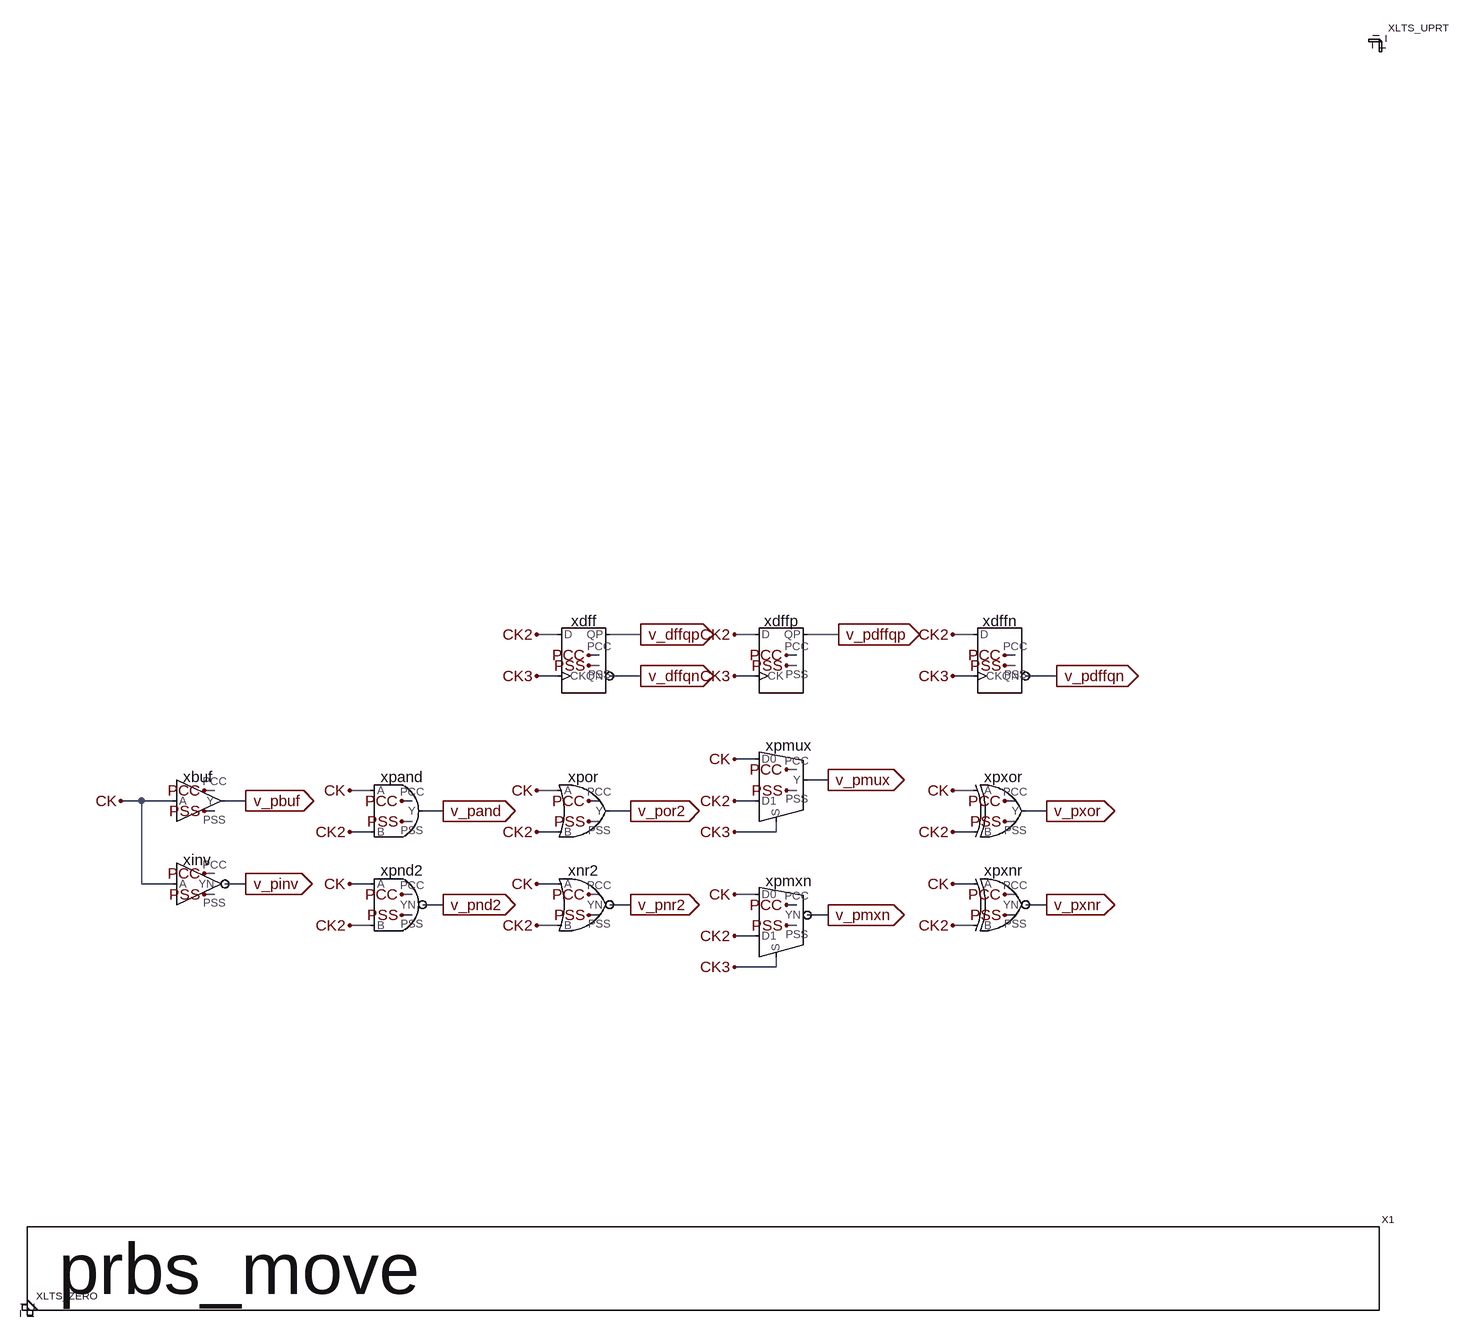
[diagram p0: schematic prbs_move.asc]
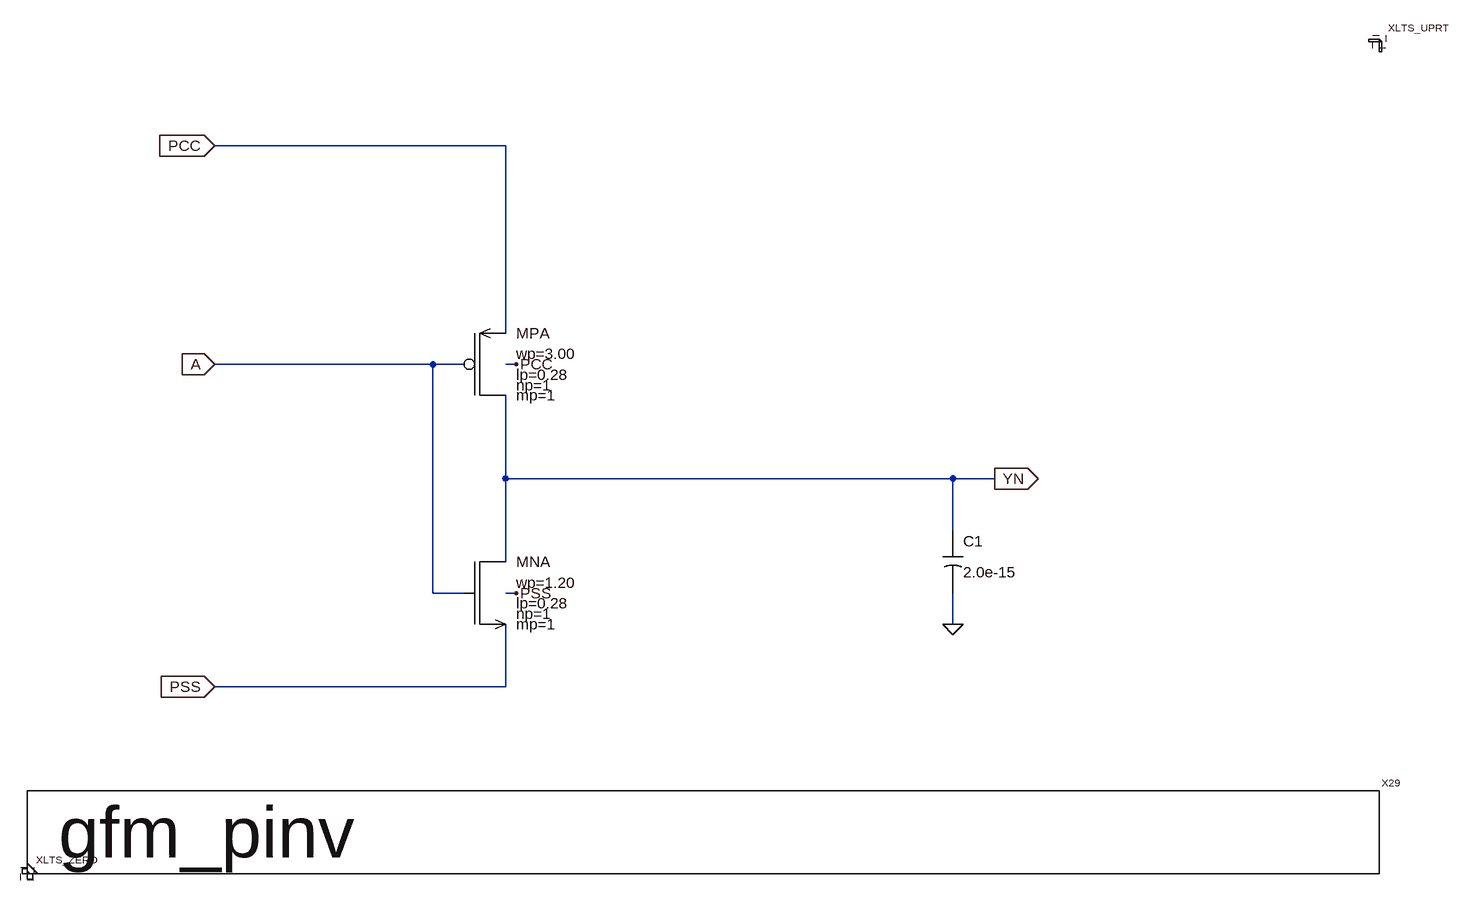
[diagram p1: sub-circuit gfm_pinv.asc]
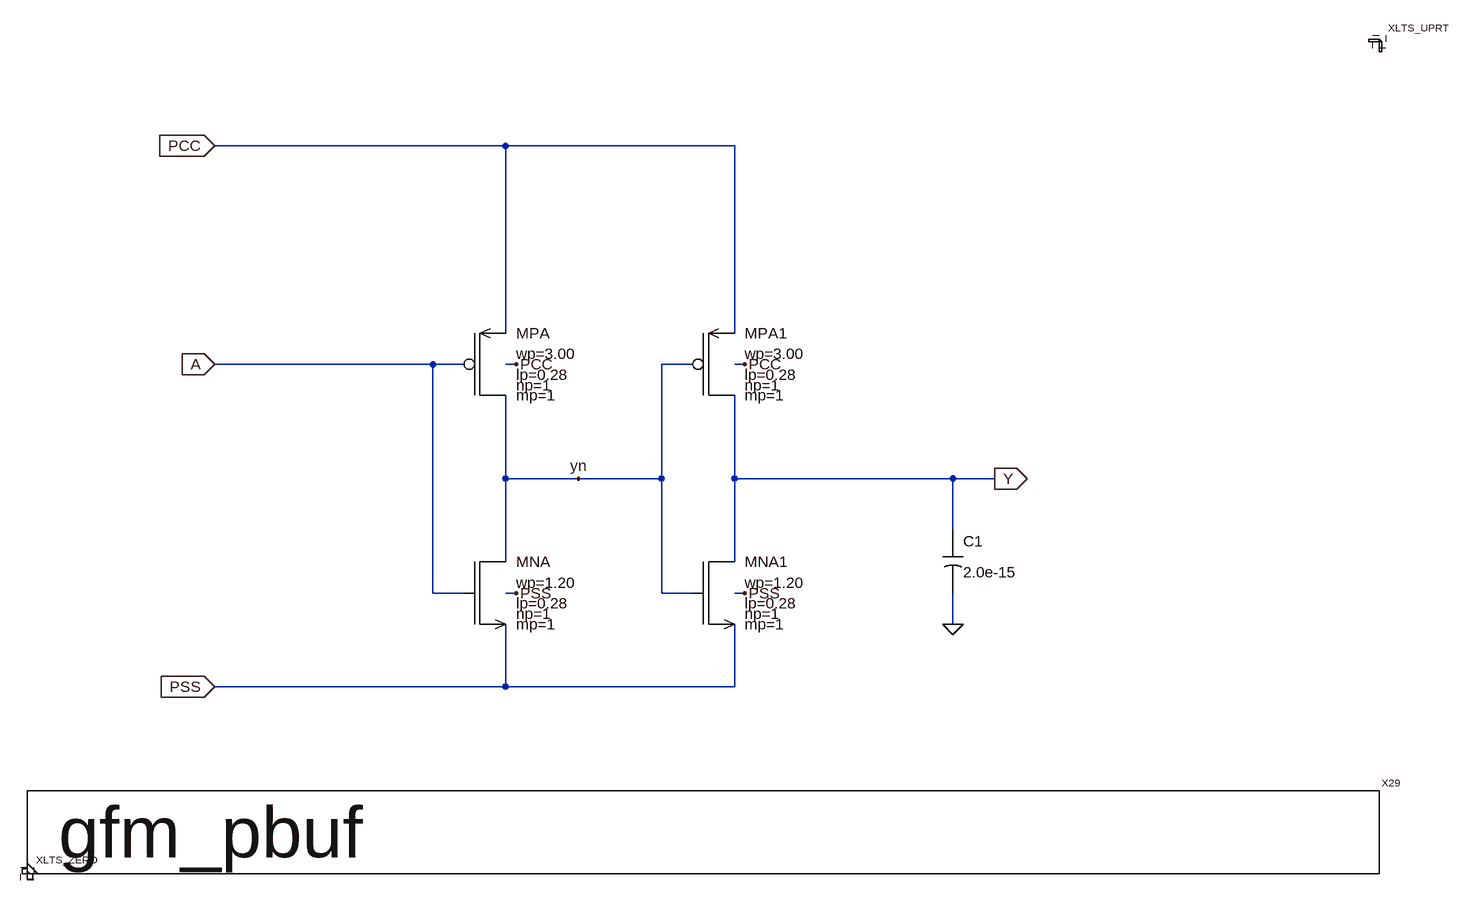
[diagram p2: sub-circuit gfm_pbuf.asc]
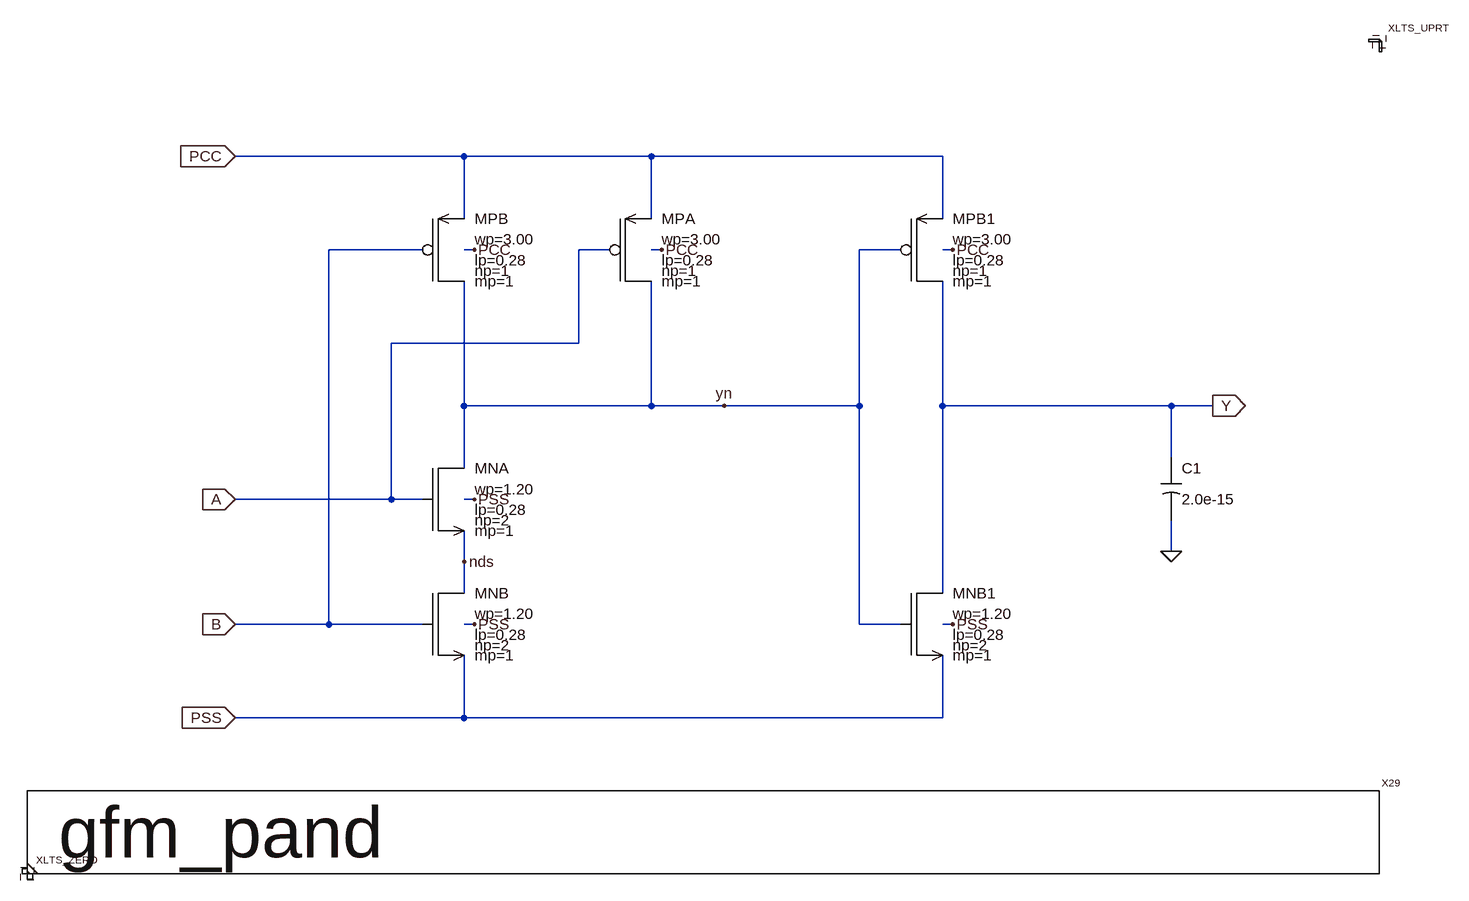
[diagram p3: sub-circuit gfm_pand.asc]
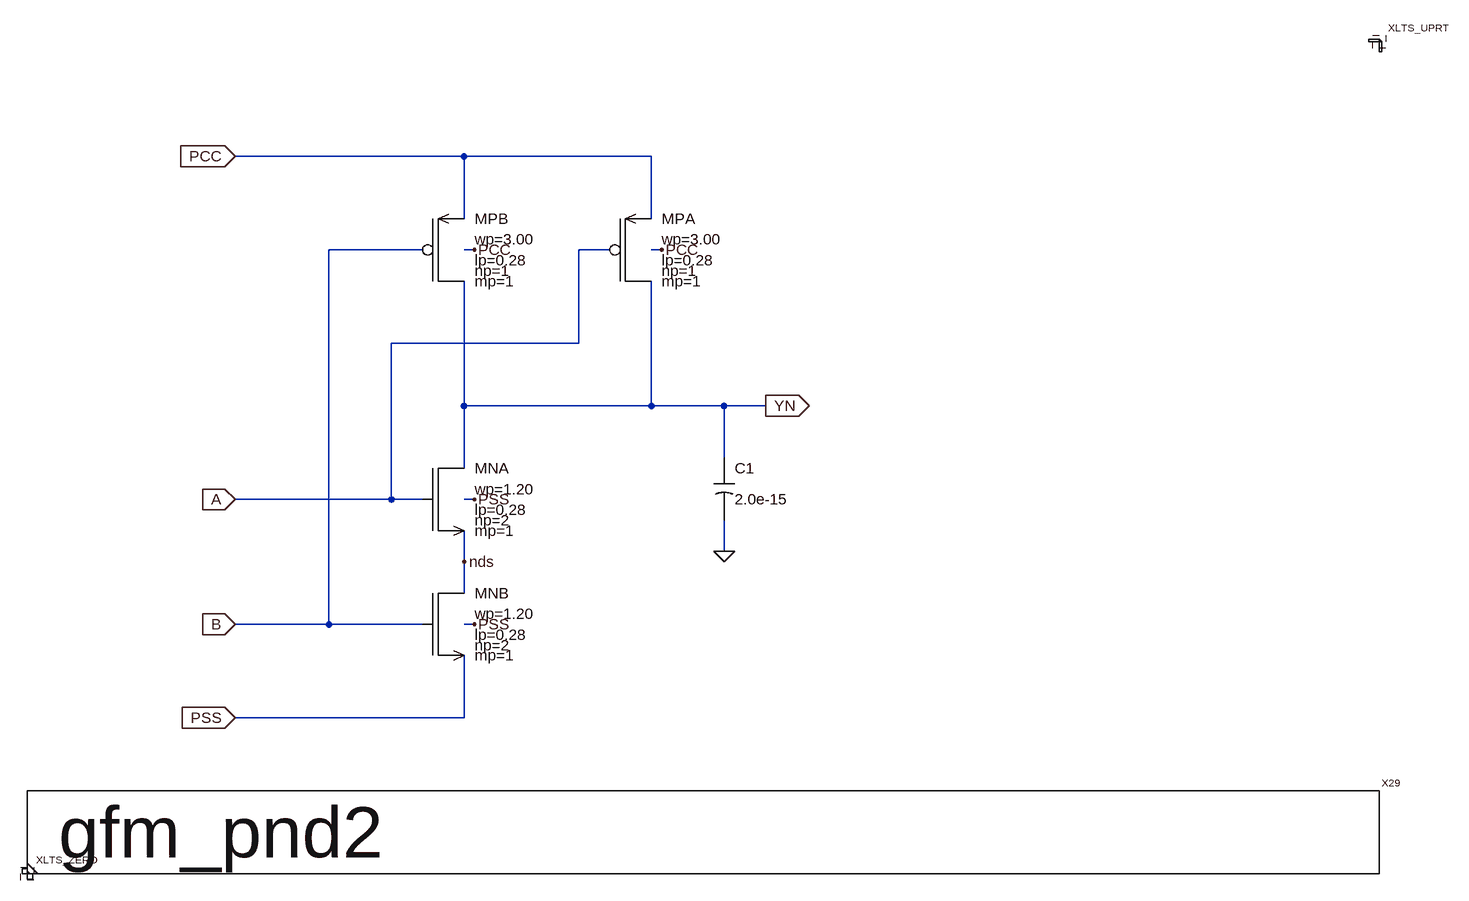
[diagram p4: sub-circuit gfm_pnd2.asc]
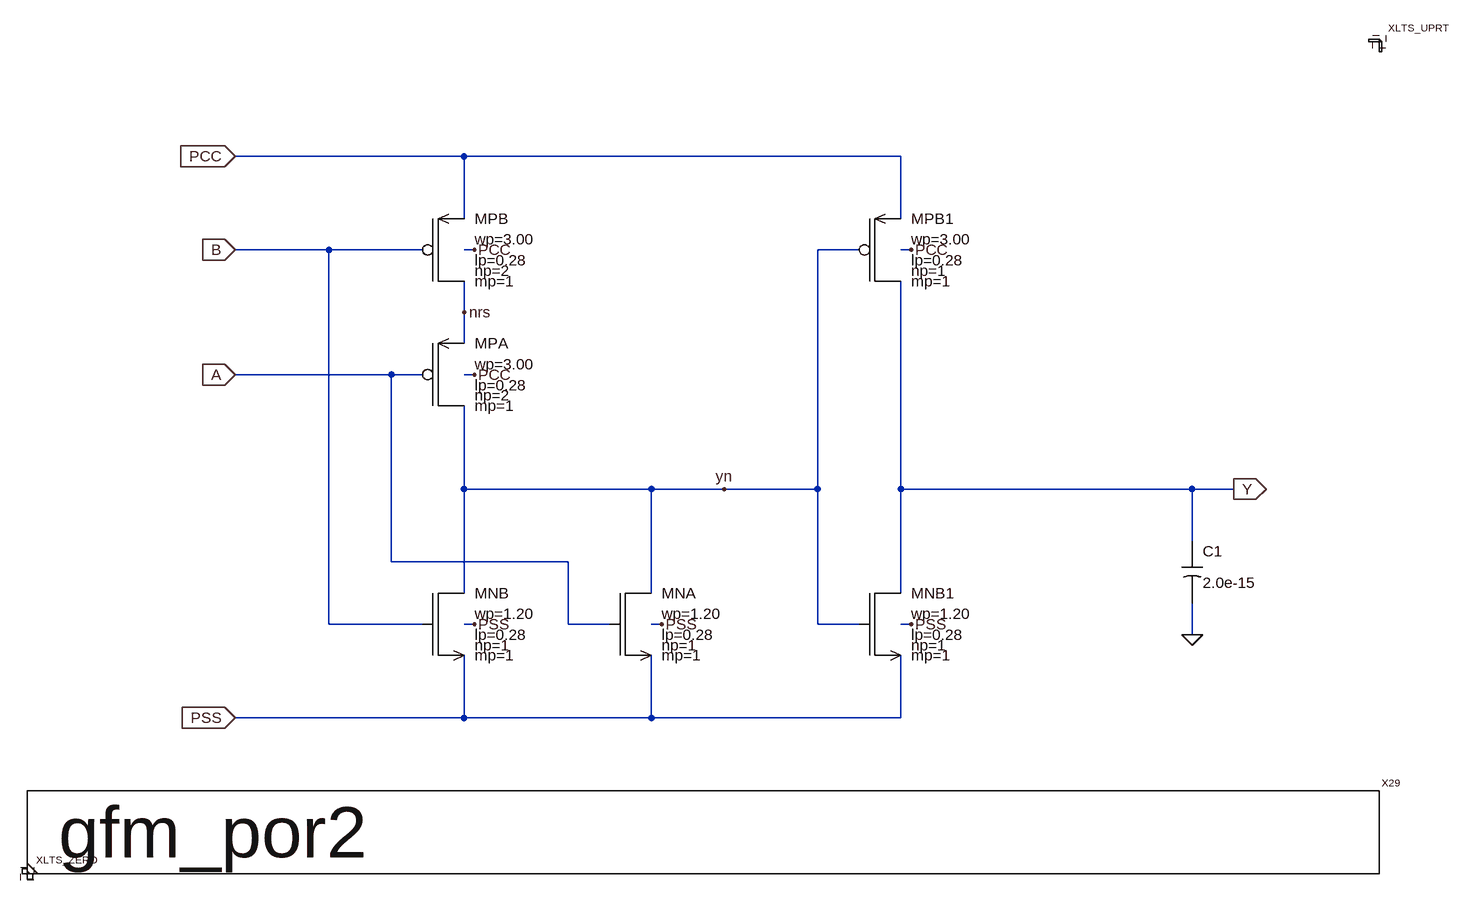
[diagram p5: sub-circuit gfm_por2.asc]
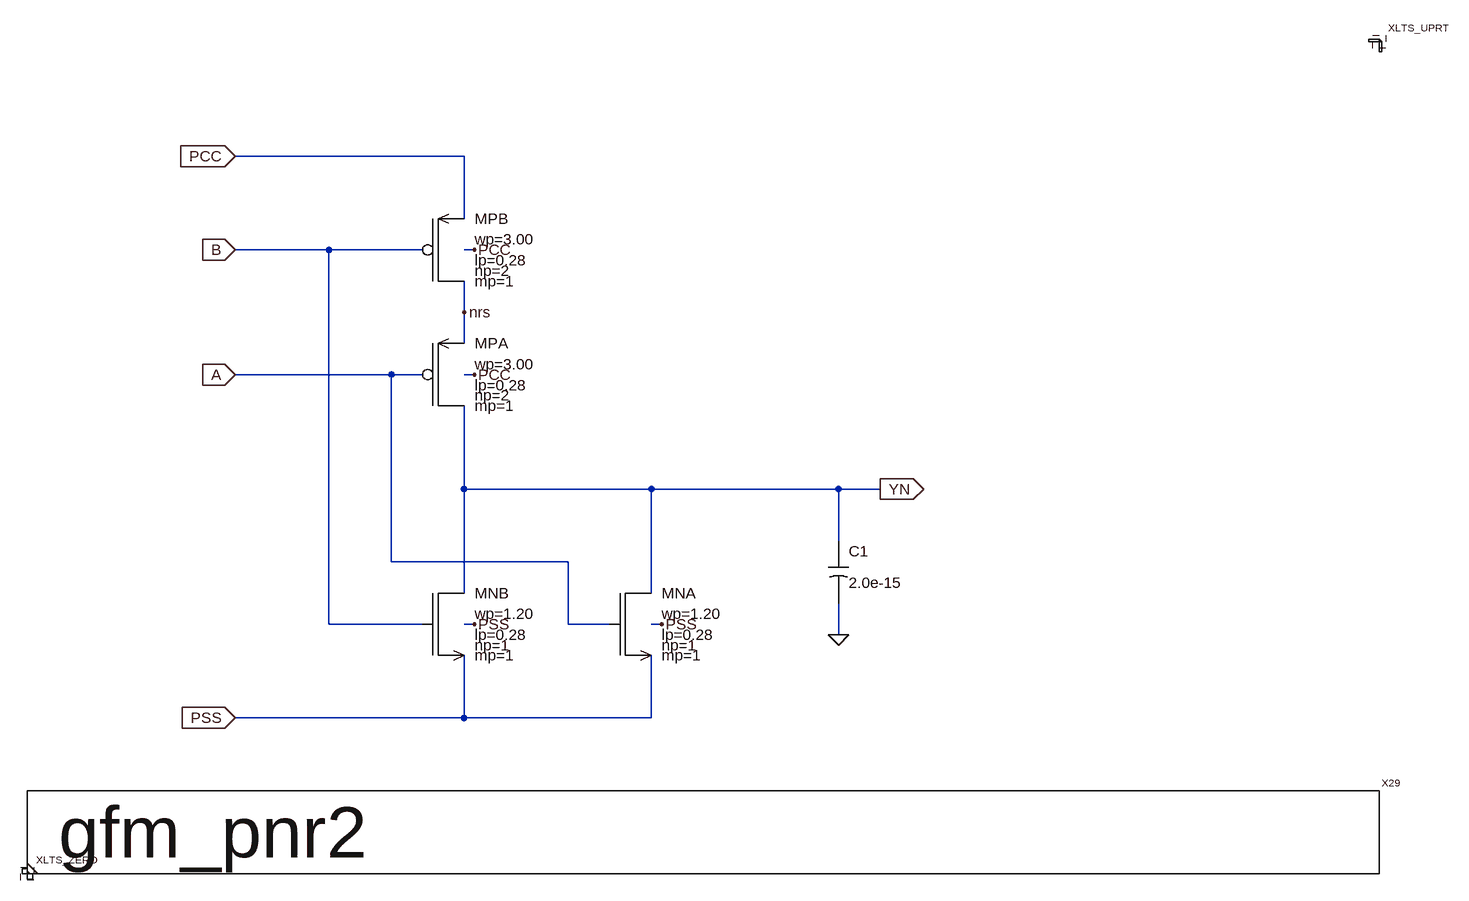
[diagram p6: sub-circuit gfm_pnr2.asc]
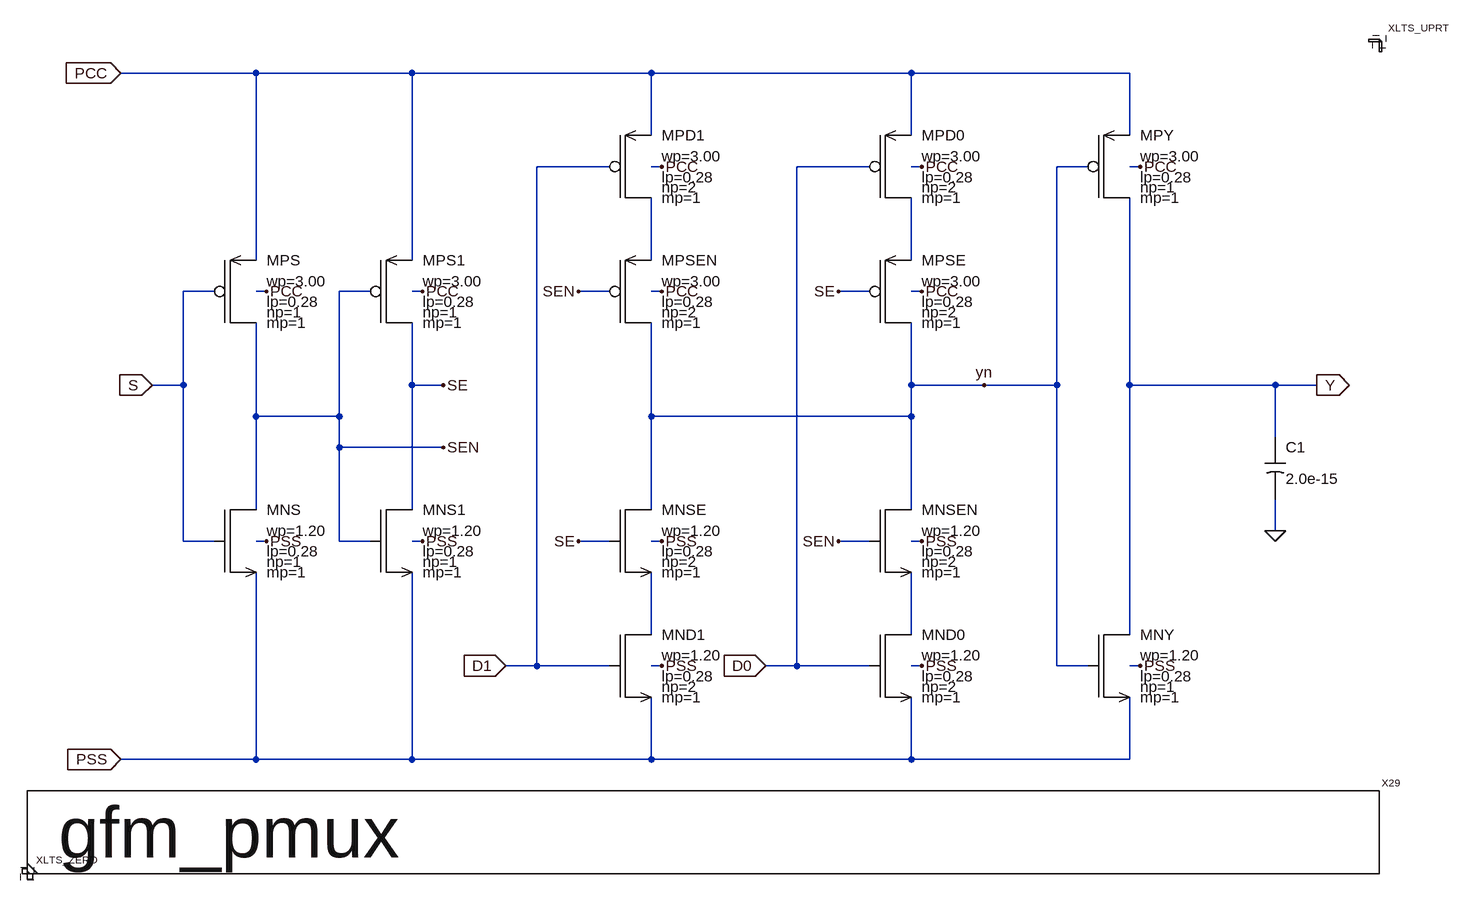
[diagram p7: sub-circuit gfm_pmux.asc]
prbs_move.asc, the LTspice schematic file:
Version 4.1
SHEET 1 4824 680
WIRE 816 -1040 784 -1040
WIRE 944 -1040 896 -1040
WIRE 1120 -1040 1088 -1040
WIRE 1248 -1040 1200 -1040
WIRE 1456 -1040 1424 -1040
WIRE 880 -1008 864 -1008
WIRE 1184 -1008 1168 -1008
WIRE 1520 -1008 1504 -1008
WIRE 880 -992 864 -992
WIRE 1184 -992 1168 -992
WIRE 1520 -992 1504 -992
WIRE 816 -976 784 -976
WIRE 944 -976 896 -976
WIRE 1120 -976 1088 -976
WIRE 1456 -976 1424 -976
WIRE 1584 -976 1536 -976
WIRE 1120 -848 1088 -848
WIRE 1184 -832 1168 -832
WIRE 1232 -816 1200 -816
WIRE 288 -800 272 -800
WIRE 528 -800 496 -800
WIRE 816 -800 784 -800
WIRE 1184 -800 1168 -800
WIRE 1456 -800 1424 -800
WIRE 176 -784 144 -784
WIRE 224 -784 176 -784
WIRE 336 -784 304 -784
WIRE 592 -784 576 -784
WIRE 880 -784 864 -784
WIRE 1120 -784 1088 -784
WIRE 1520 -784 1504 -784
WIRE 288 -768 272 -768
WIRE 640 -768 608 -768
WIRE 928 -768 896 -768
WIRE 1568 -768 1536 -768
WIRE 592 -752 576 -752
WIRE 880 -752 864 -752
WIRE 1520 -752 1504 -752
WIRE 528 -736 496 -736
WIRE 816 -736 784 -736
WIRE 1152 -736 1152 -752
WIRE 1152 -736 1088 -736
WIRE 1456 -736 1424 -736
WIRE 288 -672 272 -672
WIRE 176 -656 176 -784
WIRE 224 -656 176 -656
WIRE 336 -656 304 -656
WIRE 528 -656 496 -656
WIRE 816 -656 784 -656
WIRE 1456 -656 1424 -656
WIRE 288 -640 272 -640
WIRE 592 -640 576 -640
WIRE 880 -640 864 -640
WIRE 1120 -640 1088 -640
WIRE 1520 -640 1504 -640
WIRE 640 -624 608 -624
WIRE 928 -624 896 -624
WIRE 1184 -624 1168 -624
WIRE 1568 -624 1536 -624
WIRE 592 -608 576 -608
WIRE 880 -608 864 -608
WIRE 1232 -608 1200 -608
WIRE 1520 -608 1504 -608
WIRE 528 -592 496 -592
WIRE 816 -592 784 -592
WIRE 1184 -592 1168 -592
WIRE 1456 -592 1424 -592
WIRE 1120 -576 1088 -576
WIRE 1152 -528 1152 -544
WIRE 1152 -528 1088 -528
FLAG 272 -672 PCC
FLAG 272 -768 PSS
FLAG 272 -640 PSS
FLAG 272 -800 PCC
FLAG 144 -784 CK
FLAG 576 -784 PCC
FLAG 576 -752 PSS
FLAG 496 -800 CK
FLAG 496 -736 CK2
FLAG 640 -768 v_pand
IOPIN 640 -768 Out
FLAG 576 -640 PCC
FLAG 576 -608 PSS
FLAG 496 -656 CK
FLAG 496 -592 CK2
FLAG 640 -624 v_pnd2
IOPIN 640 -624 Out
FLAG 864 -784 PCC
FLAG 864 -752 PSS
FLAG 784 -800 CK
FLAG 784 -736 CK2
FLAG 928 -768 v_por2
IOPIN 928 -768 Out
FLAG 864 -640 PCC
FLAG 864 -608 PSS
FLAG 784 -656 CK
FLAG 784 -592 CK2
FLAG 928 -624 v_pnr2
IOPIN 928 -624 Out
FLAG 1088 -848 CK
FLAG 1088 -784 CK2
FLAG 1088 -736 CK3
FLAG 1088 -528 CK3
FLAG 1088 -640 CK
FLAG 1088 -576 CK2
FLAG 1168 -624 PCC
FLAG 1168 -592 PSS
FLAG 1168 -832 PCC
FLAG 1168 -800 PSS
FLAG 1232 -816 v_pmux
IOPIN 1232 -816 Out
FLAG 1232 -608 v_pmxn
IOPIN 1232 -608 Out
FLAG 1504 -784 PCC
FLAG 1504 -752 PSS
FLAG 1424 -800 CK
FLAG 1424 -736 CK2
FLAG 1568 -768 v_pxor
IOPIN 1568 -768 Out
FLAG 1504 -640 PCC
FLAG 1504 -608 PSS
FLAG 1424 -656 CK
FLAG 1424 -592 CK2
FLAG 1568 -624 v_pxnr
IOPIN 1568 -624 Out
FLAG 864 -1008 PCC
FLAG 864 -992 PSS
FLAG 784 -976 CK3
FLAG 784 -1040 CK2
FLAG 944 -1040 v_dffqp
IOPIN 944 -1040 Out
FLAG 944 -976 v_dffqn
IOPIN 944 -976 Out
FLAG 1168 -1008 PCC
FLAG 1168 -992 PSS
FLAG 1088 -976 CK3
FLAG 1088 -1040 CK2
FLAG 1248 -1040 v_pdffqp
IOPIN 1248 -1040 Out
FLAG 1504 -1008 PCC
FLAG 1504 -992 PSS
FLAG 1424 -976 CK3
FLAG 1424 -1040 CK2
FLAG 1584 -976 v_pdffqn
IOPIN 1584 -976 Out
FLAG 336 -784 v_pbuf
IOPIN 336 -784 Out
FLAG 336 -656 v_pinv
IOPIN 336 -656 Out
SYMBOL BD_GTitleLTS 0 0 R0
SYMATTR SpiceModel prbs_move
SYMATTR InstName X1
SYMBOL gfm_pinv 224 -656 R0
SYMATTR InstName xinv
SYMBOL gfm_pbuf 224 -784 R0
SYMATTR InstName xbuf
SYMBOL gfm_pand 528 -768 R0
SYMATTR InstName xpand
SYMBOL gfm_pnd2 528 -624 R0
SYMATTR InstName xpnd2
SYMBOL gfm_por2 816 -768 R0
SYMATTR InstName xpor
SYMBOL gfm_pnr2 816 -624 R0
SYMATTR InstName xnr2
SYMBOL gfm_pmux 1120 -816 R0
SYMATTR InstName xpmux
SYMBOL gfm_pmxn 1120 -608 R0
SYMATTR InstName xpmxn
SYMBOL gfm_pxor 1456 -768 R0
SYMATTR InstName xpxor
SYMBOL gfm_pxnr 1456 -624 R0
SYMATTR InstName xpxnr
SYMBOL gfm_dff 816 -1008 R0
SYMATTR InstName xdff
SYMBOL gfm_dffp 1120 -1008 R0
SYMATTR InstName xdffp
SYMBOL gfm_dffn 1456 -1008 R0
SYMATTR InstName xdffn
SYMBOL BD_ZERO 0 0 R0
SYMATTR InstName XLTS_ZERO
SYMBOL BD_UPRT 2080 -1952 R0
SYMATTR InstName XLTS_UPRT

The netlist it stands for:
* prbs_move.asc
X§X1 BD_GTitleLTS
X§xinv v_pinv CK PCC PSS gfm_pinv
X§xbuf v_pbuf CK PCC PSS gfm_pbuf
X§xpand v_pand CK CK2 PCC PSS gfm_pand
X§xpnd2 v_pnd2 CK CK2 PCC PSS gfm_pnd2
X§xpor v_por2 CK CK2 PCC PSS gfm_por2
X§xnr2 v_pnr2 CK CK2 PCC PSS gfm_pnr2
X§xpmux v_pmux CK CK2 CK3 PCC PSS gfm_pmux
X§xpmxn v_pmxn CK CK2 CK3 PCC PSS gfm_pmxn
X§xpxor v_pxor CK CK2 PCC PSS gfm_pxor
X§xpxnr v_pxnr CK CK2 PCC PSS gfm_pxnr
X§xdff v_dffqp v_dffqn CK2 CK3 PCC PSS gfm_dff
X§xdffp v_pdffqp CK2 CK3 PCC PSS gfm_dffp
X§xdffn v_pdffqn CK2 CK3 PCC PSS gfm_dffn
X§XLTS_ZERO BD_ZERO
X§XLTS_UPRT BD_UPRT

* block symbol definitions
.subckt gfm_pinv YN A PCC PSS
XX29 BD_GTitleLTS
C1 YN 0 2.0e-15
XMPA YN A PCC PCC gfmcu_pmos3p3 wp=3.00 lp=0.28 np=1 mp=1  ; pins ND NG NS NB
XMNA YN A PSS PSS gfmcu_nmos3p3 wp=1.20 lp=0.28 np=1 mp=1  ; pins ND NG NS NB
XXLTS_ZERO BD_ZERO
XXLTS_UPRT BD_UPRT
.ends gfm_pinv

.subckt gfm_pbuf Y A PCC PSS
XX29 BD_GTitleLTS
C1 Y 0 2.0e-15
XMPA yn A PCC PCC gfmcu_pmos3p3 wp=3.00 lp=0.28 np=1 mp=1  ; pins ND NG NS NB
XMNA yn A PSS PSS gfmcu_nmos3p3 wp=1.20 lp=0.28 np=1 mp=1  ; pins ND NG NS NB
XMPA1 Y yn PCC PCC gfmcu_pmos3p3 wp=3.00 lp=0.28 np=1 mp=1  ; pins ND NG NS NB
XMNA1 Y yn PSS PSS gfmcu_nmos3p3 wp=1.20 lp=0.28 np=1 mp=1  ; pins ND NG NS NB
XXLTS_ZERO BD_ZERO
XXLTS_UPRT BD_UPRT
.ends gfm_pbuf

.subckt gfm_pand Y A B PCC PSS
XX29 BD_GTitleLTS
XMPA yn A PCC PCC gfmcu_pmos3p3 wp=3.00 lp=0.28 np=1 mp=1  ; pins ND NG NS NB
XMPB yn B PCC PCC gfmcu_pmos3p3 wp=3.00 lp=0.28 np=1 mp=1  ; pins ND NG NS NB
XMNA yn A nds PSS gfmcu_nmos3p3 wp=1.20 lp=0.28 np=2 mp=1  ; pins ND NG NS NB
XMNB nds B PSS PSS gfmcu_nmos3p3 wp=1.20 lp=0.28 np=2 mp=1  ; pins ND NG NS NB
C1 Y 0 2.0e-15
XMPB1 Y yn PCC PCC gfmcu_pmos3p3 wp=3.00 lp=0.28 np=1 mp=1  ; pins ND NG NS NB
XMNB1 Y yn PSS PSS gfmcu_nmos3p3 wp=1.20 lp=0.28 np=2 mp=1  ; pins ND NG NS NB
XXLTS_ZERO BD_ZERO
XXLTS_UPRT BD_UPRT
.ends gfm_pand

.subckt gfm_pnd2 YN A B PCC PSS
XX29 BD_GTitleLTS
XMPA YN A PCC PCC gfmcu_pmos3p3 wp=3.00 lp=0.28 np=1 mp=1  ; pins ND NG NS NB
XMPB YN B PCC PCC gfmcu_pmos3p3 wp=3.00 lp=0.28 np=1 mp=1  ; pins ND NG NS NB
XMNA YN A nds PSS gfmcu_nmos3p3 wp=1.20 lp=0.28 np=2 mp=1  ; pins ND NG NS NB
XMNB nds B PSS PSS gfmcu_nmos3p3 wp=1.20 lp=0.28 np=2 mp=1  ; pins ND NG NS NB
C1 YN 0 2.0e-15
XXLTS_ZERO BD_ZERO
XXLTS_UPRT BD_UPRT
.ends gfm_pnd2

.subckt gfm_por2 Y A B PCC PSS
XX29 BD_GTitleLTS
XMPA yn A nrs PCC gfmcu_pmos3p3 wp=3.00 lp=0.28 np=2 mp=1  ; pins ND NG NS NB
XMPB nrs B PCC PCC gfmcu_pmos3p3 wp=3.00 lp=0.28 np=2 mp=1  ; pins ND NG NS NB
XMNA yn A PSS PSS gfmcu_nmos3p3 wp=1.20 lp=0.28 np=1 mp=1  ; pins ND NG NS NB
XMNB yn B PSS PSS gfmcu_nmos3p3 wp=1.20 lp=0.28 np=1 mp=1  ; pins ND NG NS NB
C1 Y 0 2.0e-15
XMPB1 Y yn PCC PCC gfmcu_pmos3p3 wp=3.00 lp=0.28 np=1 mp=1  ; pins ND NG NS NB
XMNB1 Y yn PSS PSS gfmcu_nmos3p3 wp=1.20 lp=0.28 np=1 mp=1  ; pins ND NG NS NB
XXLTS_ZERO BD_ZERO
XXLTS_UPRT BD_UPRT
.ends gfm_por2

.subckt gfm_pnr2 YN A B PCC PSS
XX29 BD_GTitleLTS
XMPA YN A nrs PCC gfmcu_pmos3p3 wp=3.00 lp=0.28 np=2 mp=1  ; pins ND NG NS NB
XMPB nrs B PCC PCC gfmcu_pmos3p3 wp=3.00 lp=0.28 np=2 mp=1  ; pins ND NG NS NB
XMNA YN A PSS PSS gfmcu_nmos3p3 wp=1.20 lp=0.28 np=1 mp=1  ; pins ND NG NS NB
XMNB YN B PSS PSS gfmcu_nmos3p3 wp=1.20 lp=0.28 np=1 mp=1  ; pins ND NG NS NB
C1 YN 0 2.0e-15
XXLTS_ZERO BD_ZERO
XXLTS_UPRT BD_UPRT
.ends gfm_pnr2

.subckt gfm_pmux Y D0 D1 S PCC PSS
XMNSE yn SE N003 PSS gfmcu_nmos3p3 wp=1.20 lp=0.28 np=2 mp=1  ; pins ND NG NS NB
XMND1 N003 D1 PSS PSS gfmcu_nmos3p3 wp=1.20 lp=0.28 np=2 mp=1  ; pins ND NG NS NB
C1 Y 0 2.0e-15
XMPSE yn SE N002 PCC gfmcu_pmos3p3 wp=3.00 lp=0.28 np=2 mp=1  ; pins ND NG NS NB
XMPD0 N002 D0 PCC PCC gfmcu_pmos3p3 wp=3.00 lp=0.28 np=2 mp=1  ; pins ND NG NS NB
XMPSEN yn SEN N001 PCC gfmcu_pmos3p3 wp=3.00 lp=0.28 np=2 mp=1  ; pins ND NG NS NB
XMPD1 N001 D1 PCC PCC gfmcu_pmos3p3 wp=3.00 lp=0.28 np=2 mp=1  ; pins ND NG NS NB
XX29 BD_GTitleLTS
XMNSEN yn SEN N004 PSS gfmcu_nmos3p3 wp=1.20 lp=0.28 np=2 mp=1  ; pins ND NG NS NB
XMND0 N004 D0 PSS PSS gfmcu_nmos3p3 wp=1.20 lp=0.28 np=2 mp=1  ; pins ND NG NS NB
XMNS SEN S PSS PSS gfmcu_nmos3p3 wp=1.20 lp=0.28 np=1 mp=1  ; pins ND NG NS NB
XMPS SEN S PCC PCC gfmcu_pmos3p3 wp=3.00 lp=0.28 np=1 mp=1  ; pins ND NG NS NB
XMNS1 SE SEN PSS PSS gfmcu_nmos3p3 wp=1.20 lp=0.28 np=1 mp=1  ; pins ND NG NS NB
XMPS1 SE SEN PCC PCC gfmcu_pmos3p3 wp=3.00 lp=0.28 np=1 mp=1  ; pins ND NG NS NB
XMPY Y yn PCC PCC gfmcu_pmos3p3 wp=3.00 lp=0.28 np=1 mp=1  ; pins ND NG NS NB
XMNY Y yn PSS PSS gfmcu_nmos3p3 wp=1.20 lp=0.28 np=1 mp=1  ; pins ND NG NS NB
XXLTS_ZERO BD_ZERO
XXLTS_UPRT BD_UPRT
.ends gfm_pmux

.subckt gfm_pmxn YN D0 D1 S PCC PSS
XMNSE YN SE N003 PSS gfmcu_nmos3p3 wp=1.20 lp=0.28 np=2 mp=1  ; pins ND NG NS NB
XMND1 N003 D1 PSS PSS gfmcu_nmos3p3 wp=1.20 lp=0.28 np=2 mp=1  ; pins ND NG NS NB
C1 YN 0 2.0e-15
XMPSE YN SE N002 PCC gfmcu_pmos3p3 wp=3.00 lp=0.28 np=2 mp=1  ; pins ND NG NS NB
XMPD0 N002 D0 PCC PCC gfmcu_pmos3p3 wp=3.00 lp=0.28 np=2 mp=1  ; pins ND NG NS NB
XMPSEN YN SEN N001 PCC gfmcu_pmos3p3 wp=3.00 lp=0.28 np=2 mp=1  ; pins ND NG NS NB
XMPD1 N001 D1 PCC PCC gfmcu_pmos3p3 wp=3.00 lp=0.28 np=2 mp=1  ; pins ND NG NS NB
XX29 BD_GTitleLTS
XMNSEN YN SEN N004 PSS gfmcu_nmos3p3 wp=1.20 lp=0.28 np=2 mp=1  ; pins ND NG NS NB
XMND0 N004 D0 PSS PSS gfmcu_nmos3p3 wp=1.20 lp=0.28 np=2 mp=1  ; pins ND NG NS NB
XMNS SEN S PSS PSS gfmcu_nmos3p3 wp=1.20 lp=0.28 np=1 mp=1  ; pins ND NG NS NB
XMPS SEN S PCC PCC gfmcu_pmos3p3 wp=3.00 lp=0.28 np=1 mp=1  ; pins ND NG NS NB
XMNS1 SE SEN PSS PSS gfmcu_nmos3p3 wp=1.20 lp=0.28 np=1 mp=1  ; pins ND NG NS NB
XMPS1 SE SEN PCC PCC gfmcu_pmos3p3 wp=3.00 lp=0.28 np=1 mp=1  ; pins ND NG NS NB
XXLTS_ZERO BD_ZERO
XXLTS_UPRT BD_UPRT
.ends gfm_pmxn

.subckt gfm_pxor Y A B PCC PSS
XMNA1 Y an N003 PSS gfmcu_nmos3p3 wp=1.20 lp=0.28 np=2 mp=1  ; pins ND NG NS NB
XMNB1 N003 bn PSS PSS gfmcu_nmos3p3 wp=1.20 lp=0.28 np=2 mp=1  ; pins ND NG NS NB
C1 Y 0 2.0e-15
XMPA2 Y A N002 PCC gfmcu_pmos3p3 wp=3.00 lp=0.28 np=2 mp=1  ; pins ND NG NS NB
XMPB2 N002 bn PCC PCC gfmcu_pmos3p3 wp=3.00 lp=0.28 np=2 mp=1  ; pins ND NG NS NB
XMPA1 Y an N001 PCC gfmcu_pmos3p3 wp=3.00 lp=0.28 np=2 mp=1  ; pins ND NG NS NB
XMPB1 N001 B PCC PCC gfmcu_pmos3p3 wp=3.00 lp=0.28 np=2 mp=1  ; pins ND NG NS NB
XX29 BD_GTitleLTS
XMNA2 Y A N004 PSS gfmcu_nmos3p3 wp=1.20 lp=0.28 np=2 mp=1  ; pins ND NG NS NB
XMNB2 N004 B PSS PSS gfmcu_nmos3p3 wp=1.20 lp=0.28 np=2 mp=1  ; pins ND NG NS NB
XMNA an A PSS PSS gfmcu_nmos3p3 wp=1.20 lp=0.28 np=1 mp=1  ; pins ND NG NS NB
XMPA an A PCC PCC gfmcu_pmos3p3 wp=3.00 lp=0.28 np=1 mp=1  ; pins ND NG NS NB
XMNB bn B PSS PSS gfmcu_nmos3p3 wp=1.20 lp=0.28 np=1 mp=1  ; pins ND NG NS NB
XMPB bn B PCC PCC gfmcu_pmos3p3 wp=3.00 lp=0.28 np=1 mp=1  ; pins ND NG NS NB
XXLTS_ZERO BD_ZERO
XXLTS_UPRT BD_UPRT
.ends gfm_pxor

.subckt gfm_pxnr YN A B PCC PSS
XMNA1 YN A N003 PSS gfmcu_nmos3p3 wp=1.20 lp=0.28 np=2 mp=1  ; pins ND NG NS NB
XMNB1 N003 bn PSS PSS gfmcu_nmos3p3 wp=1.20 lp=0.28 np=2 mp=1  ; pins ND NG NS NB
C1 YN 0 2.0e-15
XMPA2 YN an N002 PCC gfmcu_pmos3p3 wp=3.00 lp=0.28 np=2 mp=1  ; pins ND NG NS NB
XMPB2 N002 bn PCC PCC gfmcu_pmos3p3 wp=3.00 lp=0.28 np=2 mp=1  ; pins ND NG NS NB
XMPA1 YN A N001 PCC gfmcu_pmos3p3 wp=3.00 lp=0.28 np=2 mp=1  ; pins ND NG NS NB
XMPB1 N001 B PCC PCC gfmcu_pmos3p3 wp=3.00 lp=0.28 np=2 mp=1  ; pins ND NG NS NB
XX29 BD_GTitleLTS
XMNA2 YN an N004 PSS gfmcu_nmos3p3 wp=1.20 lp=0.28 np=2 mp=1  ; pins ND NG NS NB
XMNB2 N004 B PSS PSS gfmcu_nmos3p3 wp=1.20 lp=0.28 np=2 mp=1  ; pins ND NG NS NB
XMNA an A PSS PSS gfmcu_nmos3p3 wp=1.20 lp=0.28 np=1 mp=1  ; pins ND NG NS NB
XMPA an A PCC PCC gfmcu_pmos3p3 wp=3.00 lp=0.28 np=1 mp=1  ; pins ND NG NS NB
XMNB bn B PSS PSS gfmcu_nmos3p3 wp=1.20 lp=0.28 np=1 mp=1  ; pins ND NG NS NB
XMPB bn B PCC PCC gfmcu_pmos3p3 wp=3.00 lp=0.28 np=1 mp=1  ; pins ND NG NS NB
XXLTS_ZERO BD_ZERO
XXLTS_UPRT BD_UPRT
.ends gfm_pxnr

.subckt gfm_dff QP QN D CK PCC PSS
XMNSE ka cin N005 PSS gfmcu_nmos3p3 wp=1.20 lp=0.28 np=2 mp=1  ; pins ND NG NS NB
XMND1 N005 D PSS PSS gfmcu_nmos3p3 wp=1.20 lp=0.28 np=2 mp=1  ; pins ND NG NS NB
XMPSE ka cin N002 PCC gfmcu_pmos3p3 wp=3.00 lp=0.28 np=2 mp=1  ; pins ND NG NS NB
XMPD0 N002 kan PCC PCC gfmcu_pmos3p3 wp=3.00 lp=0.28 np=2 mp=1  ; pins ND NG NS NB
XMPSEN ka cip N001 PCC gfmcu_pmos3p3 wp=3.00 lp=0.28 np=2 mp=1  ; pins ND NG NS NB
XMPD1 N001 D PCC PCC gfmcu_pmos3p3 wp=3.00 lp=0.28 np=2 mp=1  ; pins ND NG NS NB
XX29 BD_GTitleLTS
XMNSEN ka cip N006 PSS gfmcu_nmos3p3 wp=1.20 lp=0.28 np=2 mp=1  ; pins ND NG NS NB
XMND0 N006 kan PSS PSS gfmcu_nmos3p3 wp=1.20 lp=0.28 np=2 mp=1  ; pins ND NG NS NB
XMNCK cin CK PSS PSS gfmcu_nmos3p3 wp=1.20 lp=0.28 np=1 mp=1  ; pins ND NG NS NB
XMPCK cin CK PCC PCC gfmcu_pmos3p3 wp=3.00 lp=0.28 np=1 mp=1  ; pins ND NG NS NB
XMNCKN cip cin PSS PSS gfmcu_nmos3p3 wp=1.20 lp=0.28 np=1 mp=1  ; pins ND NG NS NB
XMPCKN cip cin PCC PCC gfmcu_pmos3p3 wp=3.00 lp=0.28 np=1 mp=1  ; pins ND NG NS NB
XMPY kan ka PCC PCC gfmcu_pmos3p3 wp=3.00 lp=0.28 np=1 mp=1  ; pins ND NG NS NB
XMNY kan ka PSS PSS gfmcu_nmos3p3 wp=1.20 lp=0.28 np=1 mp=1  ; pins ND NG NS NB
XMNSE1 kb cip N007 PSS gfmcu_nmos3p3 wp=1.20 lp=0.28 np=2 mp=1  ; pins ND NG NS NB
XMND2 N007 kan PSS PSS gfmcu_nmos3p3 wp=1.20 lp=0.28 np=2 mp=1  ; pins ND NG NS NB
C2 QN 0 2.0e-15
XMPSE1 kb cip N004 PCC gfmcu_pmos3p3 wp=3.00 lp=0.28 np=2 mp=1  ; pins ND NG NS NB
XMPD2 N004 kbn PCC PCC gfmcu_pmos3p3 wp=3.00 lp=0.28 np=2 mp=1  ; pins ND NG NS NB
XMPSEN1 kb cin N003 PCC gfmcu_pmos3p3 wp=3.00 lp=0.28 np=2 mp=1  ; pins ND NG NS NB
XMPD3 N003 kan PCC PCC gfmcu_pmos3p3 wp=3.00 lp=0.28 np=2 mp=1  ; pins ND NG NS NB
XMNSEN1 kb cin N008 PSS gfmcu_nmos3p3 wp=1.20 lp=0.28 np=2 mp=1  ; pins ND NG NS NB
XMND3 N008 kbn PSS PSS gfmcu_nmos3p3 wp=1.20 lp=0.28 np=2 mp=1  ; pins ND NG NS NB
XMPY1 kbn kb PCC PCC gfmcu_pmos3p3 wp=3.00 lp=0.28 np=1 mp=1  ; pins ND NG NS NB
XMNY1 kbn kb PSS PSS gfmcu_nmos3p3 wp=1.20 lp=0.28 np=1 mp=1  ; pins ND NG NS NB
XMPY2 QN kbn PCC PCC gfmcu_pmos3p3 wp=3.00 lp=0.28 np=1 mp=1  ; pins ND NG NS NB
XMNY2 QN kbn PSS PSS gfmcu_nmos3p3 wp=1.20 lp=0.28 np=1 mp=1  ; pins ND NG NS NB
XMPY3 QP kb PCC PCC gfmcu_pmos3p3 wp=3.00 lp=0.28 np=1 mp=1  ; pins ND NG NS NB
XMNY3 QP kb PSS PSS gfmcu_nmos3p3 wp=1.20 lp=0.28 np=1 mp=1  ; pins ND NG NS NB
C1 QP 0 2.0e-15
XXLTS_ZERO BD_ZERO
XXLTS_UPRT BD_UPRT
.ends gfm_dff

.subckt gfm_dffp QP D CK PCC PSS
XMNSE ka cin N005 PSS gfmcu_nmos3p3 wp=1.20 lp=0.28 np=2 mp=1  ; pins ND NG NS NB
XMND1 N005 D PSS PSS gfmcu_nmos3p3 wp=1.20 lp=0.28 np=2 mp=1  ; pins ND NG NS NB
XMPSE ka cin N002 PCC gfmcu_pmos3p3 wp=3.00 lp=0.28 np=2 mp=1  ; pins ND NG NS NB
XMPD0 N002 kan PCC PCC gfmcu_pmos3p3 wp=3.00 lp=0.28 np=2 mp=1  ; pins ND NG NS NB
XMPSEN ka cip N001 PCC gfmcu_pmos3p3 wp=3.00 lp=0.28 np=2 mp=1  ; pins ND NG NS NB
XMPD1 N001 D PCC PCC gfmcu_pmos3p3 wp=3.00 lp=0.28 np=2 mp=1  ; pins ND NG NS NB
XX29 BD_GTitleLTS
XMNSEN ka cip N006 PSS gfmcu_nmos3p3 wp=1.20 lp=0.28 np=2 mp=1  ; pins ND NG NS NB
XMND0 N006 kan PSS PSS gfmcu_nmos3p3 wp=1.20 lp=0.28 np=2 mp=1  ; pins ND NG NS NB
XMNCK cin CK PSS PSS gfmcu_nmos3p3 wp=1.20 lp=0.28 np=1 mp=1  ; pins ND NG NS NB
XMPCK cin CK PCC PCC gfmcu_pmos3p3 wp=3.00 lp=0.28 np=1 mp=1  ; pins ND NG NS NB
XMNCKN cip cin PSS PSS gfmcu_nmos3p3 wp=1.20 lp=0.28 np=1 mp=1  ; pins ND NG NS NB
XMPCKN cip cin PCC PCC gfmcu_pmos3p3 wp=3.00 lp=0.28 np=1 mp=1  ; pins ND NG NS NB
XMPY kan ka PCC PCC gfmcu_pmos3p3 wp=3.00 lp=0.28 np=1 mp=1  ; pins ND NG NS NB
XMNY kan ka PSS PSS gfmcu_nmos3p3 wp=1.20 lp=0.28 np=1 mp=1  ; pins ND NG NS NB
XMNSE1 kb cip N007 PSS gfmcu_nmos3p3 wp=1.20 lp=0.28 np=2 mp=1  ; pins ND NG NS NB
XMND2 N007 kan PSS PSS gfmcu_nmos3p3 wp=1.20 lp=0.28 np=2 mp=1  ; pins ND NG NS NB
XMPSE1 kb cip N004 PCC gfmcu_pmos3p3 wp=3.00 lp=0.28 np=2 mp=1  ; pins ND NG NS NB
XMPD2 N004 kbn PCC PCC gfmcu_pmos3p3 wp=3.00 lp=0.28 np=2 mp=1  ; pins ND NG NS NB
XMPSEN1 kb cin N003 PCC gfmcu_pmos3p3 wp=3.00 lp=0.28 np=2 mp=1  ; pins ND NG NS NB
XMPD3 N003 kan PCC PCC gfmcu_pmos3p3 wp=3.00 lp=0.28 np=2 mp=1  ; pins ND NG NS NB
XMNSEN1 kb cin N008 PSS gfmcu_nmos3p3 wp=1.20 lp=0.28 np=2 mp=1  ; pins ND NG NS NB
XMND3 N008 kbn PSS PSS gfmcu_nmos3p3 wp=1.20 lp=0.28 np=2 mp=1  ; pins ND NG NS NB
XMPY1 kbn kb PCC PCC gfmcu_pmos3p3 wp=3.00 lp=0.28 np=1 mp=1  ; pins ND NG NS NB
XMNY1 kbn kb PSS PSS gfmcu_nmos3p3 wp=1.20 lp=0.28 np=1 mp=1  ; pins ND NG NS NB
XMPY2 PCC kbn PCC PCC gfmcu_pmos3p3 wp=3.00 lp=0.28 np=1 mp=1  ; pins ND NG NS NB
XMNY2 PSS kbn PSS PSS gfmcu_nmos3p3 wp=1.20 lp=0.28 np=1 mp=1  ; pins ND NG NS NB
XMPY3 QP kb PCC PCC gfmcu_pmos3p3 wp=3.00 lp=0.28 np=1 mp=1  ; pins ND NG NS NB
XMNY3 QP kb PSS PSS gfmcu_nmos3p3 wp=1.20 lp=0.28 np=1 mp=1  ; pins ND NG NS NB
C1 QP 0 2.0e-15
XXLTS_ZERO BD_ZERO
XXLTS_UPRT BD_UPRT
.ends gfm_dffp

.subckt gfm_dffn QN D CK PCC PSS
XMNSE ka cin N005 PSS gfmcu_nmos3p3 wp=1.20 lp=0.28 np=2 mp=1  ; pins ND NG NS NB
XMND1 N005 D PSS PSS gfmcu_nmos3p3 wp=1.20 lp=0.28 np=2 mp=1  ; pins ND NG NS NB
XMPSE ka cin N002 PCC gfmcu_pmos3p3 wp=3.00 lp=0.28 np=2 mp=1  ; pins ND NG NS NB
XMPD0 N002 kan PCC PCC gfmcu_pmos3p3 wp=3.00 lp=0.28 np=2 mp=1  ; pins ND NG NS NB
XMPSEN ka cip N001 PCC gfmcu_pmos3p3 wp=3.00 lp=0.28 np=2 mp=1  ; pins ND NG NS NB
XMPD1 N001 D PCC PCC gfmcu_pmos3p3 wp=3.00 lp=0.28 np=2 mp=1  ; pins ND NG NS NB
XX29 BD_GTitleLTS
XMNSEN ka cip N006 PSS gfmcu_nmos3p3 wp=1.20 lp=0.28 np=2 mp=1  ; pins ND NG NS NB
XMND0 N006 kan PSS PSS gfmcu_nmos3p3 wp=1.20 lp=0.28 np=2 mp=1  ; pins ND NG NS NB
XMNCK cin CK PSS PSS gfmcu_nmos3p3 wp=1.20 lp=0.28 np=1 mp=1  ; pins ND NG NS NB
XMPCK cin CK PCC PCC gfmcu_pmos3p3 wp=3.00 lp=0.28 np=1 mp=1  ; pins ND NG NS NB
XMNCKN cip cin PSS PSS gfmcu_nmos3p3 wp=1.20 lp=0.28 np=1 mp=1  ; pins ND NG NS NB
XMPCKN cip cin PCC PCC gfmcu_pmos3p3 wp=3.00 lp=0.28 np=1 mp=1  ; pins ND NG NS NB
XMPY kan ka PCC PCC gfmcu_pmos3p3 wp=3.00 lp=0.28 np=1 mp=1  ; pins ND NG NS NB
XMNY kan ka PSS PSS gfmcu_nmos3p3 wp=1.20 lp=0.28 np=1 mp=1  ; pins ND NG NS NB
XMNSE1 kb cip N007 PSS gfmcu_nmos3p3 wp=1.20 lp=0.28 np=2 mp=1  ; pins ND NG NS NB
XMND2 N007 kan PSS PSS gfmcu_nmos3p3 wp=1.20 lp=0.28 np=2 mp=1  ; pins ND NG NS NB
C2 QN 0 2.0e-15
XMPSE1 kb cip N004 PCC gfmcu_pmos3p3 wp=3.00 lp=0.28 np=2 mp=1  ; pins ND NG NS NB
XMPD2 N004 kbn PCC PCC gfmcu_pmos3p3 wp=3.00 lp=0.28 np=2 mp=1  ; pins ND NG NS NB
XMPSEN1 kb cin N003 PCC gfmcu_pmos3p3 wp=3.00 lp=0.28 np=2 mp=1  ; pins ND NG NS NB
XMPD3 N003 kan PCC PCC gfmcu_pmos3p3 wp=3.00 lp=0.28 np=2 mp=1  ; pins ND NG NS NB
XMNSEN1 kb cin N008 PSS gfmcu_nmos3p3 wp=1.20 lp=0.28 np=2 mp=1  ; pins ND NG NS NB
XMND3 N008 kbn PSS PSS gfmcu_nmos3p3 wp=1.20 lp=0.28 np=2 mp=1  ; pins ND NG NS NB
XMPY1 kbn kb PCC PCC gfmcu_pmos3p3 wp=3.00 lp=0.28 np=1 mp=1  ; pins ND NG NS NB
XMNY1 kbn kb PSS PSS gfmcu_nmos3p3 wp=1.20 lp=0.28 np=1 mp=1  ; pins ND NG NS NB
XMPY2 QN kbn PCC PCC gfmcu_pmos3p3 wp=3.00 lp=0.28 np=1 mp=1  ; pins ND NG NS NB
XMNY2 QN kbn PSS PSS gfmcu_nmos3p3 wp=1.20 lp=0.28 np=1 mp=1  ; pins ND NG NS NB
XMPY3 PCC kb PCC PCC gfmcu_pmos3p3 wp=3.00 lp=0.28 np=1 mp=1  ; pins ND NG NS NB
XMNY3 PSS kb PSS PSS gfmcu_nmos3p3 wp=1.20 lp=0.28 np=1 mp=1  ; pins ND NG NS NB
XXLTS_ZERO BD_ZERO
XXLTS_UPRT BD_UPRT
.ends gfm_dffn

.lib dmodels_analog.lib
.lib models_gfmcu.lib
.backanno
.end